# Altium project Zybo_Z7.PrjPcb (part 3 of 3)

## Sheet Power_Regulation.SchDoc
size A4; SheetNumber: 13; SheetTotal: 13
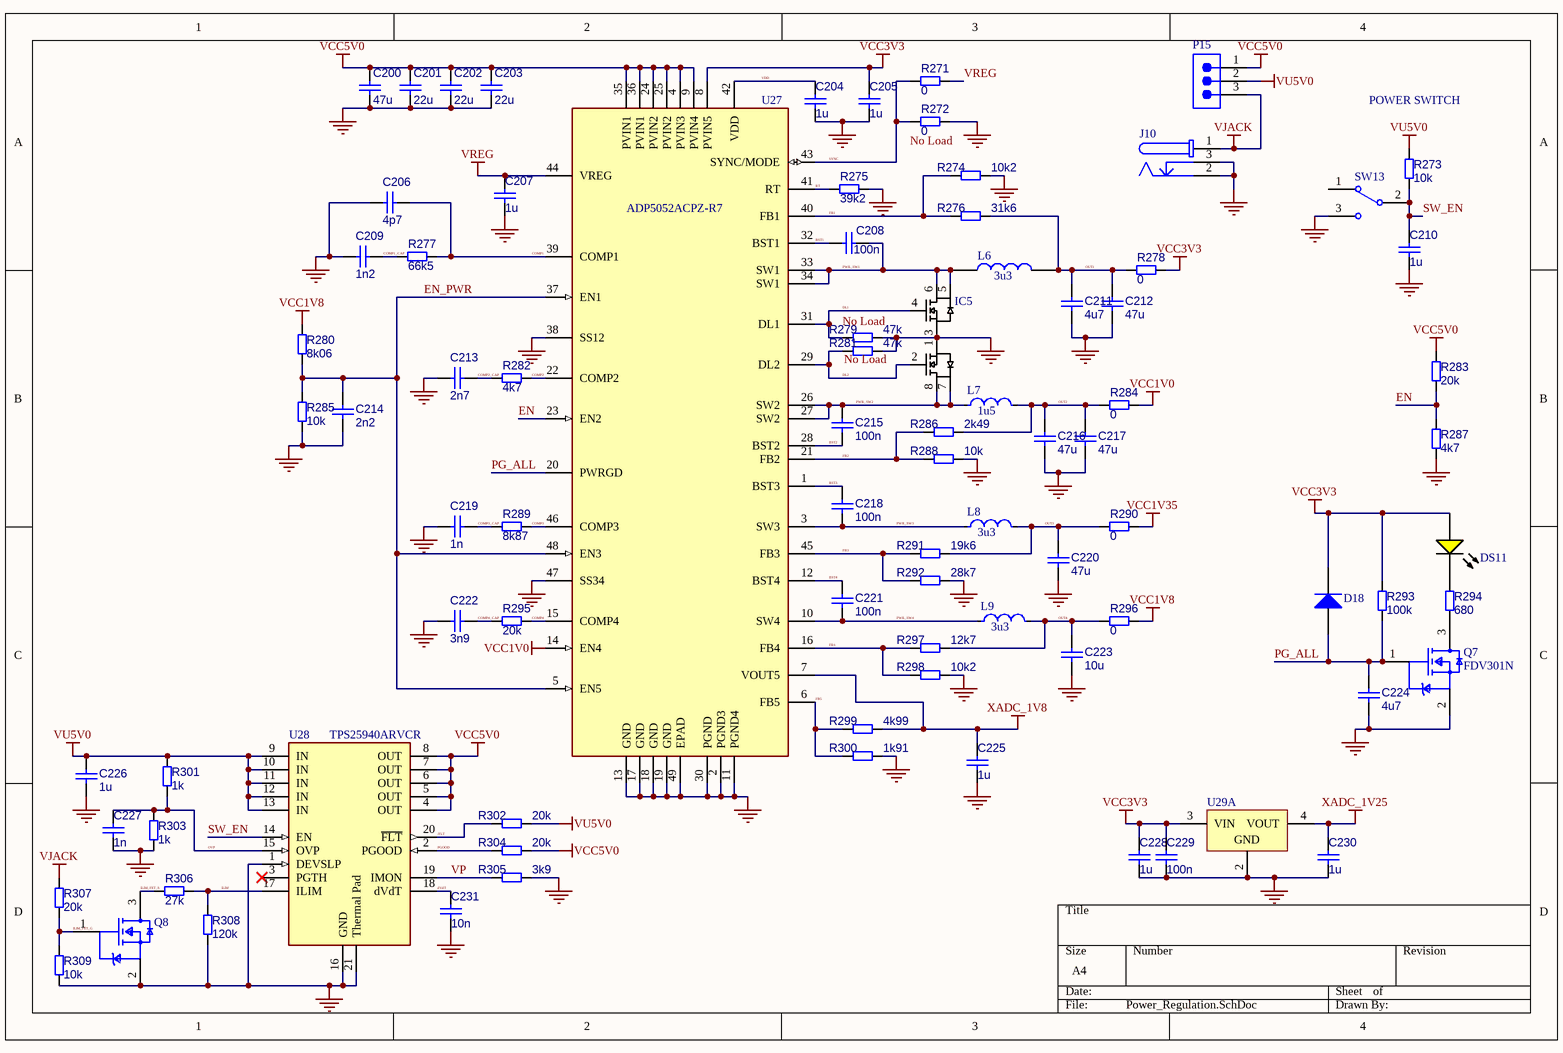
[diagram p12: Power_Regulation.SchDoc]

### Parts
C200  47u  [C_1210]
C201  22u  [C_1210]
C202  22u  [C_1210]
C203  22u  [C_1210]
C204  1u  [C_0402]
C205  1u  [C_0402]
C206  4p7  [CAPC1005X50N_0402]
C207  1u  [C_0402]
C208  100n  [CAPC1005X50N_0402]
C209  1n2  [CAPC1005X50N_0402]
C210  1u  [C_0402]
C211  4u7  [C_0805]
C212  47u  [C_1210]
C213  2n7  [CAPC1005X50N_0402]
C214  2n2  [CAPC1005X50N_0402]
C215  100n  [CAPC1005X50N_0402]
C216  47u  [C_1210]
C217  47u  [C_1210]
C218  100n  [CAPC1005X50N_0402]
C219  1n  [CAPC1005X50N_0402]
C220  47u  [C_1210]
C221  100n  [CAPC1005X50N_0402]
C222  3n9  [CAPC1005X50N_0402]
C223  10u  [C_0805]
C224  4u7  [C_0805]
C225  1u  [C_0402]
C226  1u  [C_0805]
C227  1n  [CAPC1005X50N_0402]
C228  1u  [C_0402]
C229  100n  [CAPC1005X50N_0402]
C230  1u  [C_0402]
C231  10n  [CAPC1005X50N_0402]
D18  BAS16XV2T1G  [ONSC-SOD-523-2-502-01_V]  (value not drawn)
DS11  19-217/Y5C-AM1N1VY/3T  [EVRL-0603-2_V]  (value not drawn)
IC5  FDS9926A  [SOIC127P600X175-8N]  (value not drawn)
J10  694108301002  [694108301002]  (value not drawn)
L6  3u3  [ETQP3M_4M_YFP]
L7  1u5  [FP-IHLP-2020CZ-FP_1_905x2-MFG]
L8  3u3  [FP-IHLP-2020CZ-FP_1_905x2-MFG]
L9  3u3  [FP-IHLP-2020CZ-FP_1_905x2-MFG]
P15  Male Pin Header 1x3 2.54mm  [Copy of Copy of Copy of Copy of Copy of 3M-2340-6111TG_V]  (value not drawn)
Q7  FDV301N  [FP-318-08-MFG]
Q8  FDV301N  [FP-318-08-MFG]  (value not drawn)
R271  0  [R_0402]
R272  0  [R_0402]
R273  10k  [R_0402]
R274  10k2  [R_0402]
R275  39k2  [R_0402]
R276  31k6  [R_0402]
R277  66k5  [R_0402]
R278  0  [R_0402]
R279  47k  [R_0402]
R280  8k06  [R_0402]
R281  47k  [R_0402]
R282  4k7  [R_0402]
R283  20k  [R_0402]
R284  0  [R_0402]
R285  10k  [R_0402]
R286  2k49  [R_0402]
R287  4k7  [R_0402]
R288  10k  [R_0402]
R289  8k87  [R_0402]
R290  0  [R_0402]
R291  19k6  [R_0402]
R292  28k7  [R_0402]
R293  100k  [R_0402]
R294  680  [R_0402]
R295  20k  [R_0402]
R296  0  [R_0402]
R297  12k7  [R_0402]
R298  10k2  [R_0402]
R299  4k99  [R_0402]
R300  1k91  [R_0402]
R301  1k  [R_0402]
R302  20k  [R_0402]
R303  1k  [R_0402]
R304  20k  [R_0402]
R305  3k9  [R_0402]
R306  27k  [R_0402]
R307  20k  [R_0402]
R308  120k  [R_0402]
R309  10k  [R_0402]
SW13  EG1218  [ESWI-EG1218_V]  (value not drawn)
U27  ADP5052ACPZ-R7  [FP-CP-48-13-IPC_B]
U28  TPS25940ARVCR  [FP-RVC0020A-IPC_A]
U29  ADR127BUJZ-REEL7  [ADI-UJ-6_M]  (value not drawn)  (part A of 2)

### Nets
GND: C200.2 C201.2 C202.2 C203.2 C204.1 C205.1 C206.2 C207.1 C209.2 C210.1 C211.1 C212.2 C213.1 C214.2 C216.2 C217.2 C219.1 C220.2 C222.1 C223.1 C224.1 C225.1 C226.1 C227.1 C228.1 C229.1 C230.1 C231.1 IC5.1(S2) IC5.3(S1) J10.2 J10.3 Q7.2(S) Q8.2(S) R272.2 R274.2 R275.2 R279.2 R281.2 R285.2 R287.2 R288.2 R292.2 R298.2 R300.2 R303.1 R305.2 R308.1 R309.1 SW13.3 U27.2(PGND3) U27.11(PGND4) U27.13(GND) U27.17(GND) U27.18(GND) U27.19(GND) U27.30(PGND) U27.38(SS12) U27.47(SS34) U27.49(EPAD) U28.1(DEVSLP) U28.16(GND) U28.21(Thermal_Pad) U29.2(GND)
VCC1V0: R284.1 U27.14(EN4)
VCC1V8: R280.1 R296.1
VCC1V35: R290.1
VCC3V3: C205.2 C228.2 C229.2 D18.1(K) DS11.1(A) R278.1 R293.1 U27.8(PVIN5) U29.3(VIN)
VCC5V0: C200.1 C201.1 C202.1 C203.1 P15.1 R283.1 R304.2 U27.4(PVIN3) U27.9(PVIN4) U27.24(PVIN2) U27.25(PVIN2) U27.35(PVIN1) U27.36(PVIN1) U28.4(OUT) U28.5(OUT) U28.6(OUT) U28.7(OUT) U28.8(OUT)
VJACK: J10.1 P15.3 R307.2
VREG: C207.2 R271.2 U27.44(VREG)
VU5V0: C226.2 P15.2 R273.1 R301.2 R302.2 U28.9(IN) U28.10(IN) U28.11(IN) U28.12(IN) U28.13(IN)
XADC_1V8: C225.2 R299.2 U27.7(VOUT5)
XADC_1V25: C230.2 U29.4(VOUT)
/FLT: R302.1 U28.20(~{FLT})
BST1: C208.1 U27.32(BST1)
BST2: C215.2 U27.28(BST2)
BST3: C218.1 U27.1(BST3)
BST4: C221.1 U27.12(BST4)
COMP1: C206.1 R277.1 U27.39(COMP1)
COMP1_CAP: C209.1 R277.2
COMP2: R282.2 U27.22(COMP2)
COMP2_CAP: C213.2 R282.1
COMP3: R289.2 U27.46(COMP3)
COMP3_CAP: C219.2 R289.1
COMP4: R295.2 U27.15(COMP4)
COMP4_CAP: C222.2 R295.1
DL1: IC5.4(G1) R279.1 U27.31(DL1)
DL2: IC5.2(G2) R281.1 U27.29(DL2)
dVdT: C231.2 U28.18(dVdT)
EN: R283.2 R287.1 U27.23(EN2)
EN_PWR: C214.1 R280.2 R285.1 U27.5(EN5) U27.37(EN1) U27.48(EN3)
FB1: R274.1 R276.1 U27.40(FB1)
FB2: R286.1 R288.1 U27.21(FB2)
FB3: R291.1 R292.1 U27.45(FB3)
FB4: R297.1 R298.1 U27.16(FB4)
FB5: R299.1 R300.1 U27.6(FB5)
ILIM: R306.1 R308.2 U28.17(ILIM)
ILIM_FET_G: Q8.1(G) R307.1 R309.2
ILIM_FET_S: Q8.3(D) R306.2
OUT1: C211.2 C212.1 L6.2 R276.2 R278.2
OUT2: C216.1 C217.1 L7.2 R284.2 R286.2
OUT3: C220.1 L8.2 R290.2 R291.2
OUT4: C223.2 L9.2 R296.2 R297.2
OVP: C227.2 R301.1 R303.2 U28.15(OVP)
PG_ALL: C224.2 D18.2(A) Q7.1(G) R293.2 U27.20(PWRGD)
PGOOD: R304.1 U28.2(PGOOD)
PWR_SW1: C208.2 IC5.5(D1_1) IC5.6(D1_2) L6.1 U27.33(SW1) U27.34(SW1)
PWR_SW2: C215.1 IC5.7(D2_1) IC5.8(D2_2) L7.1 U27.26(SW2) U27.27(SW2)
PWR_SW3: C218.2 L8.1 U27.3(SW3)
PWR_SW4: C221.2 L9.1 U27.10(SW4)
RT: R275.1 U27.41(RT)
SW_EN: C210.2 R273.2 SW13.2(COM) U28.14(EN)
SYNC: R271.1 R272.1 U27.43(SYNC/MODE)
VDD: C204.2 U27.42(VDD)
VP: R305.1 U28.19(IMON)
NetDS11_2: DS11.2(K) R294.1
NetQ7_3: Q7.3(D) R294.2

Not connected (* = marked no-connect by the designer): SW13 1; U28 3(PGTH)*

### Notes on the sheet
- (near R273) POWER SWITCH
- (near R272) No Load
- (near R279) No Load
- (near R281) No Load

### Library data of the parts
C200-C203 C212 C216 C217 C220 = CMP-001-00088-1: as C93-C95 on sheet FPGA_Power
C204 C205 C207 C210 C225 C228 C230 = CMP-001-00085-2: MLCC 0603
C206 C208 C209 C213-C215 C218 C219 C221 C222 C227 C229 C231 = CMP-001-00084-2: MLCC 0402
C211 C223 C224 C226 = CMP-001-00086-2: MLCC 0805
D18 = CMP-1054-00076-1: Switching Diode, 2-Pin SOD-523, Pb-Free, Tape and Reel; Manufacturer: On Semiconductor; trr Max (ns): 6; Configuration: Single; IF Max (A): 0.2; ComponentLink1URL: http://www.onsemi.com/; DatasheetVersion: Rev. 7; RoHS: TRUE; PackageVersion: Rev. E, 09/2010; Packing: Tape and Reel; ComponentLink2Description: Datasheet; ComponentLink2URL: http://www.onsemi.com/pub_link/Collateral/BAS16XV2T1-D.PDF; ComponentLink3Description: Package Specification; PackageReference: SOD-523-2-502-01; ComponentLink1Description: Manufacturer URL; PartNumber: BAS16XV2T1G; Mounting Technology: Surface Mount; PackageDescription: 2-Pin SOD, Body 1.2 x 0.8 mm; ComponentLink3URL: http://www.onsemi.com/pub_link/Collateral/502-01.PDF
DS11 = CMP-007-00005-2: Chip LED, Yellow, 5 V, 25mA, -40 to 85 degC, 2-Pin SMD (0603), RoHS, Tape and Reel; Manufacturer: Everlight Electronics; Datasheet Version: Rev. 1.0, 12/2005; Package Reference: 0603; Mounting Technology: SM; Package Description: 2-Pin Surface Mount Device, Body 1.6 x 0.8 mm; Case/Package: 0603; Datasheet URL: http://www.fairchip.com/pdf/Everlight/19-217-Y5C-AM1N1VY-3T.pdf; Manufacturer URL: http://www.everlight.com/; RoHS Compliant: False
IC5 = FDS9926A: Integrated Circuit; Manufacturer_Name: onsemi; Datasheet Link: https://www.onsemi.com/pub/Collateral/FDS9926A-D.PDF; Height: 1.75mm; Manufacturer_Part_Number: FDS9926A; Mouser Part Number: 512-FDS9926A; Mouser Price/Stock: https://www.mouser.co.uk/ProductDetail/onsemi-Fairchild/FDS9926A?qs=HK%252BeIG1iaagpgrEVRWCDdA%3D%3D; Arrow Part Number: FDS9926A; Arrow Price/Stock: https://www.arrow.com/en/products/fds9926a/on-semiconductor?utm_currency=USD&region=nac
J10 = CMP-1502-00190-4: DC Power Jack Connector WR-DC, Male, Right Angled, THT, 5 A, 24 V; Operating Supply Voltage: 24V; Shielding: Unshielded; Voltage Rating: 30V; Number of Contacts: 3; Insulation Resistance: 100MΩ; Current Rating: 5A; Min Operating Temperature: -40°C; Packaging: Bulk; Connector Type: Power; Housing Material: Polyamide; REACH SVHC: Unknown; Termination: Through Hole; Contact Gender: Female; Mount: Through Hole; RoHS: Compliant; Flammability Rating: UL94 V-0; Height: 11mm; Max Operating Temperature: 85°C; Contact Plating: Tin; Color: Black; Gender: Male; Contact Material: Gold, Tin
L6 = ETQ-P3M3R3YFP: Inductor; Manufacturer_Name: Panasonic; Datasheet Link: https://industrial.panasonic.com/cdbs/www-data/pdf/AGL0000/AGL0000C59.pdf; Height: 4mm; Manufacturer_Part_Number: ETQ-P3M3R3YFP; Mouser Part Number: 667-ETQ-P3M3R3YFP; Mouser Price/Stock: https://www.mouser.co.uk/ProductDetail/Panasonic/ETQ-P3M3R3YFP?qs=sL7MMaRBAPWa%252BM34GljCkQ%3D%3D; Arrow Part Number: ETQ-P3M3R3YFP; Arrow Price/Stock: https://www.arrow.com/en/products/etq-p3m3r3yfp/panasonic.html?utm_currency=USD&region=nac
L7-L9 = CMP-02424-000709-1: Fixed Inductors Commercial High Saturation Series 1.5uH 7.2A 20.7mΩ 20%; Max DC Current: 11A; DC Resistance (DCR): 20.7mR; Core Material: Metal; Shielding: Shielded; Test Frequency: 100kHz; Self Resonant Frequency: 5MHz; Length: 5.49mm; Package Quantity: 2000; Height - Seated (Max): 0.118inch; Inductance Tolerance: 20%; Lead Free: Lead Free; Current Rating: 7.2A; Max Operating Temperature: 125°C; Series: IHLP-2020CZ-01; Termination: SMD/SMT; RoHS Compliant: Yes; Width: 5.18mm; Military Standard: Not; Inductance: 1.5uH; Radiation Hardening: No; Case/Package: 2020; Saturation Current: 11A; Packaging: Tape and Reel; RMS Current (Irms): 7.2A; Tolerance: 20%; Depth: 5.43mm; Min Operating Temperature: -55°C; Mount: Surface Mount; Height: 3mm
P15 = CMP-002-00080-1: Male Header, Pitch 2.54 mm, 1x3 Position, Height 8.636 mm, Tail Length 3.05 mm, -55 to 105 degC, RoHS, Bulk; Manufacturer: 3M; Rows: 1; Current Rating: 3A; Mounting Technology: TH; Contact Plating: Gold; Packaging: Bulk; Lead Pitch: 0.1inch; Case/Package: 2340-6111TG; Contact Material: Copper; Pins: 40; Package Description: Male Header, Pitch 2.54 mm, 1 x 40 Position, Height 8.636 mm, Tail Length 3.05 mm; RoHS Compliant: True; Connector Type: Header; Manufacturer URL: http://www.3m.com/; Contact Finish: Gold; Max Operating Temperature: 105°C; Min Operating Temperature: -55°C; Max Current Rating: 3A; Gender: Male; Package Quantity: 200; Colour: Black; Package Reference: 2340-6111TG; Datasheet URL: https://datasheet.ciiva.com/5161/ts0766-242217-5161112.pdf; Datasheet Version: Aug-08
Q7 Q8 = CMP-2000-04935-2: MOSFET N-CH 25V 220MA SOT-23; Manufacturer: ON Semiconductor; Turn Off Delay Time: 3.5ns; Typ Forward Diode Voltage: 0.8V; Max Junction Temp: +150°C; Threshold Vgs Max: 1.06V; Threshold Vgs Min: 0.7V; Standoff Height: 0.01mm; Max Forward Diode Voltage: 1.2V; Number Of Channels: 1; Rthja Max: 357°C/W; Drain To Source Resistance: 3.1Ω; Input Capacitace At Vds: 9.5pF @ 10V; Gate Charge At Vgs: 0.49nC @ 4.5V; Transconductance: 0.2S; Turn On Delay Time: 3.2ns; Depletion Mode: False; Power Dissipation: 0.35W; Continuous Drain Current: 0.22A; Gate To Source Voltage: 8V; RoHS: TRUE; Lead Free: Yes; Temperature Range High: +150°C; Automotive: No; Height: 1.11mm; Category: Trans; Mouser Description: MOSFET N-Ch Digital; Drain To Source Voltage: 25V; Temperature: -55°C to +150°C; Ipc Land Pattern Name: SOT95P240X100-3; Device Class L1: Discrete Semiconductors; Octopart: https://octopart.com/fdv301n-on+semiconductor-84326713; Footprint Url: https://www.onsemi.com/pub/Collateral/318-08.PDF; Digikey Description: MOSFET N-CH 25V 220MA SOT-23; Drain To Source Breakdown Voltage: 25V; Temperature Range Low: -55°C; Number Of N Channels: 1; Device Class L3: MOSFETs; Package: 318-08; ComponentLink2URL: https://www.onsemi.com/pub/Collateral/FDV301N-D.PDF; Manufacturer Part Number: FDV301N; Device Class L2: Transistors; ComponentLink2Description: Datasheet
R271-R309 = CMP-009-00178-3: Chip 0402 resistor
SW13 = CMP-011-00006-2: Slide Switch, SPDT, 500 V, -20 to 70 degC, 3-Pin THD, RoHS, Bulk; Manufacturer: E-Switch; Voltage Rating (DC): 30V; Current Rating: 200mA; Operating Force: 250gf; Package Quantity: 1000; Contact Plating: Silver; Max Operating Temperature: 70°C; Min Operating Temperature: -20°C; Contact Material: Copper; Datasheet URL: https://www.e-switch.com/system/asset/product_line/data_sheet/119/EG.pdf; Contact Finish: Silver; Case/Package: EG1218; Voltage Rating (AC): 30V; Datasheet Version: Oct-15; Package Description: 3-Pin Through Hole Device, Body 11.6 x 4 mm, Pitch 2.5 mm; RoHS Compliant: True; Package Reference: EG1218; Manufacturer URL: http://www.e-switch.ch/en/; Throw Configuration: SPDT; Contact Current Rating: 200mA; Mounting Technology: TH; Packaging: Bulk; Pins: 3
U27 = CMP-019-00062-1: 5-Channel Integrated Power Solution with Quad Buck Regulators and 200 mA LDO Regulator; Nominal Supply Current: 4.8mA; Output Voltage: 3.305V; Min Supply Voltage: 4.5V; Output Current: 200mA; Max Supply Voltage: 15V; Pins: 48; Max Operating Temperature: 125°C; Mounting Technology: Surface Mount; Min Operating Temperature: -40°C; Case/Package: LFCSP EP
U28 = CMP-019-00063-1: 2.7-V to 18-V, 42mΩ, 0.6-5.2A eFuse with reverse current blocking and DevSleep support 20-WQFN -40 to 85; Output Current: 5.3A; Max Supply Voltage: 18V; Nominal Supply Current: 2.02mA; Min Supply Voltage: 2.7V; Mounting Technology: Surface Mount; Pins: 20; Max Operating Temperature: 85°C; Min Operating Temperature: -40°C
U29 = CMP-0784-00537-1: Precision, Micropower LDO Voltage Reference in TSOT, 1.25 V Output, 2.7 to 18 V Supply, Industrial, 6-pin SOT23 (UJ-6), Reel; Manufacturer: Analog Devices; Max V Supply (V): 18; Vout: 1.25V; Ref Out TC (ppm/C): 3; Min V Supply (V): 2.7; ComponentLink1URL: http://www.analog.com/en/index.html; PartNumber: ADR127BUJZ-REEL7; Operating Temp Range: -40 to 125 degC; ComponentLink4URL: Product URL:http://www.analog.com/en/special-linear-functions/voltage-references/adr127/products/product.html; ComponentLink1Description: Manufacturer URL; Code_JEDEC: MO-193-AA; Packing: Reel; ComponentLink3Description: Package Specification; ComponentLink2URL: http://www.analog.com/static/imported-files/data_sheets/ADR121_125_127.pdf; ComponentLink2Description: Datasheet; DatasheetVersion: Rev. B; Mounting Technology: Surface Mount; PackageReference: UJ-6; PackageDescription: 6-Pin Thin Small Outline Transistor Package, Body 2.9 x 1.6 mm, Pitch 0.95 mm; ComponentLink3URL: http://www.analog.com/static/imported-files/packages/PKG_PDF/TSOT(UJ)/UJ_6.pdf; ComponentLink4Description: URL Link1; PackageVersion: Dec-04

## Nets that join several sheets
DDR3_VREF: DDR_and_MIO_Banks (6 pins), DDR3_Memory (8 pins)
GND: PMODs_MIO (75 pins), MIPI_General_IO (28 pins), Ethernet_and_SD_Card (43 pins), Audio_Codec (41 pins), HDMI_Source (16 pins), HDMI_Sink (30 pins), USB_OTG (18 pins), FPGA_Config_Flash (26 pins), DDR_and_MIO_Banks (16 pins), FPGA_Power (132 pins), DDR3_Memory (85 pins), Power_Regulation (64 pins)
VCC1V0: Ethernet_and_SD_Card (C8.2 FB8.1), FPGA_Power (36 pins), Power_Regulation (R284.1 U27.14)
VCC1V8: USB_OTG (R188.2), FPGA_Power (23 pins), Power_Regulation (R280.1 R296.1)
VCC1V8_IO: PMODs_MIO (SW1.3 SW1.4 SW2.3 SW2.4), Ethernet_and_SD_Card (6 pins), USB_OTG (C68.2 R187.2 U20.11 U20.32), DDR_and_MIO_Banks (R233.1 R249.2), FPGA_Power (10 pins)
VCC1V35: DDR_and_MIO_Banks (R232.1 R248.2), FPGA_Power (22 pins), DDR3_Memory (76 pins), Power_Regulation (R290.1)
VCC3V3: PMODs_MIO (12 pins), MIPI_General_IO (13 pins), Ethernet_and_SD_Card (16 pins), Audio_Codec (FB5.1 R120.2 R132.1 R133.1), HDMI_Source (19 pins), HDMI_Sink (36 pins), USB_OTG (C71.2 R190.1 U20.20 U20.21), FPGA_Config_Flash (14 pins), DDR_and_MIO_Banks (8 pins), FPGA_Power (42 pins), Power_Regulation (9 pins)
VCC5V0: MIPI_General_IO (6 pins), Audio_Codec (FB6.1), HDMI_Source (F1.1), USB_OTG (C69.2 U21.5), FPGA_Config_Flash (C77.2 D16.2), Power_Regulation (18 pins)
XADC_1V8: FPGA_Config_Flash (1.J9 C75.2), Power_Regulation (C225.2 R299.2 U27.7)
XADC_1V25: FPGA_Config_Flash (1.L9 C74.2), Power_Regulation (C230.2 U29.4)
AC_BCLK: Audio_Codec (R123.1), FPGA_Banks_and_Filters (1.H16)
AC_MCLK: Audio_Codec (R128.1), FPGA_Banks_and_Filters (1.J14)
AC_MUTEN: Audio_Codec (R130.1 U15.25), FPGA_Banks_and_Filters (1.G14)
AC_PBDAT: Audio_Codec (U15.8), FPGA_Banks_and_Filters (1.J20)
AC_PBLRC: Audio_Codec (U15.9), FPGA_Banks_and_Filters (1.J15)
AC_RECDAT: Audio_Codec (U15.10), FPGA_Banks_and_Filters (1.M14)
AC_RECLRC: Audio_Codec (U15.11), FPGA_Banks_and_Filters (1.M15)
AC_SCL: Audio_Codec (R132.2 U15.28), FPGA_Banks_and_Filters (1.G15)
AC_SDA: Audio_Codec (R133.2 U15.27), FPGA_Banks_and_Filters (1.H15)
BTN0: MIPI_General_IO (R63.1), FPGA_Banks_and_Filters (1.R19)
BTN1: MIPI_General_IO (R59.1), FPGA_Banks_and_Filters (1.J16)
BTN2: MIPI_General_IO (R57.1), FPGA_Banks_and_Filters (1.G19)
BTN3: MIPI_General_IO (R55.1), FPGA_Banks_and_Filters (1.N17)
CAM_CLK: MIPI_General_IO (J1.12), FPGA_Banks_and_Filters (1.V16)
CAM_GPIO: MIPI_General_IO (J1.11), FPGA_Banks_and_Filters (1.W16)
CAM_SCL: MIPI_General_IO (J1.13), FPGA_Banks_and_Filters (1.T20)
CAM_SDA: MIPI_General_IO (J1.14), FPGA_Banks_and_Filters (1.U20)
CRYPTO_SDA: FPGA_Config_Flash (R198.1 U22.5), FPGA_Banks_and_Filters (1.H17)
DDR3_A0: DDR_and_MIO_Banks (R228.2), DDR3_Memory (U25.N3 U26.N3)
DDR3_A1: DDR_and_MIO_Banks (R227.2), DDR3_Memory (U25.P7 U26.P7)
DDR3_A2: DDR_and_MIO_Banks (R226.2), DDR3_Memory (U25.P3 U26.P3)
DDR3_A3: DDR_and_MIO_Banks (R225.2), DDR3_Memory (U25.N2 U26.N2)
DDR3_A4: DDR_and_MIO_Banks (R224.2), DDR3_Memory (U25.P8 U26.P8)
DDR3_A5: DDR_and_MIO_Banks (R223.2), DDR3_Memory (U25.P2 U26.P2)
DDR3_A6: DDR_and_MIO_Banks (R222.2), DDR3_Memory (U25.R8 U26.R8)
DDR3_A7: DDR_and_MIO_Banks (R221.2), DDR3_Memory (U25.R2 U26.R2)
DDR3_A8: DDR_and_MIO_Banks (R220.2), DDR3_Memory (U25.T8 U26.T8)
DDR3_A9: DDR_and_MIO_Banks (R219.2), DDR3_Memory (U25.R3 U26.R3)
DDR3_A10: DDR_and_MIO_Banks (R217.2), DDR3_Memory (U25.L7 U26.L7)
DDR3_A11: DDR_and_MIO_Banks (R215.2), DDR3_Memory (U25.R7 U26.R7)
DDR3_A12: DDR_and_MIO_Banks (R213.2), DDR3_Memory (U25.N7 U26.N7)
DDR3_A13: DDR_and_MIO_Banks (R211.2), DDR3_Memory (U25.T3 U26.T3)
DDR3_A14: DDR_and_MIO_Banks (R209.2), DDR3_Memory (U25.T7 U26.T7)
DDR3_BA0: DDR_and_MIO_Banks (R231.2), DDR3_Memory (U25.M2 U26.M2)
DDR3_BA1: DDR_and_MIO_Banks (R230.2), DDR3_Memory (U25.N8 U26.N8)
DDR3_BA2: DDR_and_MIO_Banks (R229.2), DDR3_Memory (U25.M3 U26.M3)
DDR3_CAS: DDR_and_MIO_Banks (R236.2), DDR3_Memory (U25.K3 U26.K3)
DDR3_CK_N: DDR_and_MIO_Banks (1.M2 R242.1), DDR3_Memory (U25.K7 U26.K7)
DDR3_CK_P: DDR_and_MIO_Banks (1.L2 R242.2), DDR3_Memory (U25.J7 U26.J7)
DDR3_CKE0: DDR_and_MIO_Banks (R241.2), DDR3_Memory (U25.K9 U26.K9)
DDR3_CS: DDR_and_MIO_Banks (R237.2), DDR3_Memory (U25.L2 U26.L2)
DDR3_D0: DDR_and_MIO_Banks (1.E3), DDR3_Memory (U25.E3)
DDR3_D1: DDR_and_MIO_Banks (1.H1), DDR3_Memory (U25.F7)
DDR3_D2: DDR_and_MIO_Banks (1.E2), DDR3_Memory (U25.F2)
DDR3_D3: DDR_and_MIO_Banks (1.G3), DDR3_Memory (U25.F8)
DDR3_D4: DDR_and_MIO_Banks (1.J3), DDR3_Memory (U25.H3)
DDR3_D5: DDR_and_MIO_Banks (1.H2), DDR3_Memory (U25.H8)
DDR3_D6: DDR_and_MIO_Banks (1.H3), DDR3_Memory (U25.G2)
DDR3_D7: DDR_and_MIO_Banks (1.J1), DDR3_Memory (U25.H7)
DDR3_D8: DDR_and_MIO_Banks (1.D3), DDR3_Memory (U25.D7)
DDR3_D9: DDR_and_MIO_Banks (1.B3), DDR3_Memory (U25.C3)
DDR3_D10: DDR_and_MIO_Banks (1.E1), DDR3_Memory (U25.C8)
DDR3_D11: DDR_and_MIO_Banks (1.C3), DDR3_Memory (U25.C2)
DDR3_D12: DDR_and_MIO_Banks (1.C1), DDR3_Memory (U25.A7)
DDR3_D13: DDR_and_MIO_Banks (1.A4), DDR3_Memory (U25.A2)
DDR3_D14: DDR_and_MIO_Banks (1.D1), DDR3_Memory (U25.B8)
DDR3_D15: DDR_and_MIO_Banks (1.A2), DDR3_Memory (U25.A3)
DDR3_D16: DDR_and_MIO_Banks (1.U4), DDR3_Memory (U26.E3)
DDR3_D17: DDR_and_MIO_Banks (1.R3), DDR3_Memory (U26.F7)
DDR3_D18: DDR_and_MIO_Banks (1.U2), DDR3_Memory (U26.F2)
DDR3_D19: DDR_and_MIO_Banks (1.U3), DDR3_Memory (U26.F8)
DDR3_D20: DDR_and_MIO_Banks (1.R1), DDR3_Memory (U26.H3)
DDR3_D21: DDR_and_MIO_Banks (1.P3), DDR3_Memory (U26.H8)
DDR3_D22: DDR_and_MIO_Banks (1.T4), DDR3_Memory (U26.G2)
DDR3_D23: DDR_and_MIO_Banks (1.P1), DDR3_Memory (U26.H7)
DDR3_D24: DDR_and_MIO_Banks (1.W3), DDR3_Memory (U26.D7)
DDR3_D25: DDR_and_MIO_Banks (1.W1), DDR3_Memory (U26.C3)
DDR3_D26: DDR_and_MIO_Banks (1.Y4), DDR3_Memory (U26.C8)
DDR3_D27: DDR_and_MIO_Banks (1.V1), DDR3_Memory (U26.C2)
DDR3_D28: DDR_and_MIO_Banks (1.Y2), DDR3_Memory (U26.A7)
DDR3_D29: DDR_and_MIO_Banks (1.V2), DDR3_Memory (U26.A2)
DDR3_D30: DDR_and_MIO_Banks (1.Y3), DDR3_Memory (U26.B8)
DDR3_D31: DDR_and_MIO_Banks (1.V3), DDR3_Memory (U26.A3)
DDR3_DM0: DDR_and_MIO_Banks (1.F1), DDR3_Memory (U25.E7)
DDR3_DM1: DDR_and_MIO_Banks (1.A1), DDR3_Memory (U25.D3)
DDR3_DM2: DDR_and_MIO_Banks (1.T1), DDR3_Memory (U26.E7)
DDR3_DM3: DDR_and_MIO_Banks (1.Y1), DDR3_Memory (U26.D3)
DDR3_DQS0_N: DDR_and_MIO_Banks (1.F2), DDR3_Memory (U25.G3)
DDR3_DQS0_P: DDR_and_MIO_Banks (1.G2), DDR3_Memory (U25.F3)
DDR3_DQS1_N: DDR_and_MIO_Banks (1.B2), DDR3_Memory (U25.B7)
DDR3_DQS1_P: DDR_and_MIO_Banks (1.C2), DDR3_Memory (U25.C7)
DDR3_DQS2_N: DDR_and_MIO_Banks (1.T2), DDR3_Memory (U26.G3)
DDR3_DQS2_P: DDR_and_MIO_Banks (1.R2), DDR3_Memory (U26.F3)
DDR3_DQS3_N: DDR_and_MIO_Banks (1.W4), DDR3_Memory (U26.B7)
DDR3_DQS3_P: DDR_and_MIO_Banks (1.W5), DDR3_Memory (U26.C7)
DDR3_ODT0: DDR_and_MIO_Banks (R244.2), DDR3_Memory (U25.K1 U26.K1)
DDR3_RAS: DDR_and_MIO_Banks (R235.2), DDR3_Memory (U25.J3 U26.J3)
DDR3_RESET: DDR_and_MIO_Banks (1.B4), DDR3_Memory (R270.2 U25.T2 U26.T2)
DDR3_WE: DDR_and_MIO_Banks (R238.2), DDR3_Memory (U25.L3 U26.L3)
ETH_INT_PU_B: Ethernet_and_SD_Card (IC1.31), FPGA_Banks_and_Filters (1.P14)
ETH_MDC: Ethernet_and_SD_Card (IC1.13), DDR_and_MIO_Banks (1.C10)
ETH_MDIO: Ethernet_and_SD_Card (IC1.14 R108.1), DDR_and_MIO_Banks (1.C11)
ETH_RST_B: Ethernet_and_SD_Card (C1.2 D1.2 IC1.12 R90.1), FPGA_Banks_and_Filters (1.U13)
ETH_RXCK: Ethernet_and_SD_Card (R102.1), DDR_and_MIO_Banks (1.B17)
ETH_RXCTL: Ethernet_and_SD_Card (R101.1), DDR_and_MIO_Banks (1.D13)
ETH_RXD0: Ethernet_and_SD_Card (R93.1), DDR_and_MIO_Banks (1.D11)
ETH_RXD1: Ethernet_and_SD_Card (R98.1), DDR_and_MIO_Banks (1.A16)
ETH_RXD2: Ethernet_and_SD_Card (R99.1), DDR_and_MIO_Banks (1.F15)
ETH_RXD3: Ethernet_and_SD_Card (R100.1), DDR_and_MIO_Banks (1.A15)
ETH_TXCK: Ethernet_and_SD_Card (IC1.20), DDR_and_MIO_Banks (R207.1)
ETH_TXCTL: Ethernet_and_SD_Card (IC1.19), DDR_and_MIO_Banks (R216.1)
ETH_TXD0: Ethernet_and_SD_Card (IC1.18), DDR_and_MIO_Banks (R208.1)
ETH_TXD1: Ethernet_and_SD_Card (IC1.17), DDR_and_MIO_Banks (R210.1)
ETH_TXD2: Ethernet_and_SD_Card (IC1.16), DDR_and_MIO_Banks (R212.1)
ETH_TXD3: Ethernet_and_SD_Card (IC1.15), DDR_and_MIO_Banks (R214.1)
FAN_FB_PU: FPGA_Config_Flash (R206.1), FPGA_Banks_and_Filters (1.Y12)
HDMI_RX0_N: HDMI_Sink (R161.1 U19.16), FPGA_Banks_and_Filters (1.G18)
HDMI_RX0_P: HDMI_Sink (R160.1 U19.15), FPGA_Banks_and_Filters (1.G17)
HDMI_RX1_N: HDMI_Sink (R163.1 U19.13), FPGA_Banks_and_Filters (1.F20)
HDMI_RX1_P: HDMI_Sink (R162.1 U19.12), FPGA_Banks_and_Filters (1.F19)
HDMI_RX2_N: HDMI_Sink (R165.1 U19.10), FPGA_Banks_and_Filters (1.H18)
HDMI_RX2_P: HDMI_Sink (R164.1 U19.9), FPGA_Banks_and_Filters (1.J18)
HDMI_RX_CEC: HDMI_Sink (D12.1 J7.13), FPGA_Banks_and_Filters (1.Y9)
HDMI_RX_CLK_N: HDMI_Sink (R159.1 U19.19), FPGA_Banks_and_Filters (1.K18)
HDMI_RX_CLK_P: HDMI_Sink (R158.1 U19.18), FPGA_Banks_and_Filters (1.K17)
HDMI_RX_HPD: HDMI_Sink (R157.2 U18.2), FPGA_Banks_and_Filters (1.L15)
HDMI_RX_SCL: HDMI_Sink (R183.1 U19.22), FPGA_Banks_and_Filters (1.L14)
HDMI_RX_SDA: HDMI_Sink (R184.1 U19.23), FPGA_Banks_and_Filters (1.H20)
HDMI_TX0_N: HDMI_Source (IC3.11 R143.2), FPGA_Banks_and_Filters (1.W13)
HDMI_TX0_P: HDMI_Source (IC3.10 R144.2), FPGA_Banks_and_Filters (1.V12)
HDMI_TX1_N: HDMI_Source (IC3.8 R145.2), FPGA_Banks_and_Filters (1.T10)
HDMI_TX1_P: HDMI_Source (IC3.7 R146.2), FPGA_Banks_and_Filters (1.T11)
HDMI_TX2_N: HDMI_Source (IC3.6 R147.2), FPGA_Banks_and_Filters (1.U12)
HDMI_TX2_P: HDMI_Source (IC3.5 R148.2), FPGA_Banks_and_Filters (1.T12)
HDMI_TX_CEC: HDMI_Source (D2.1 IC3.15), FPGA_Banks_and_Filters (1.T15)
HDMI_TX_CLK_N: HDMI_Source (IC3.13 R141.2), FPGA_Banks_and_Filters (1.P19)
HDMI_TX_CLK_P: HDMI_Source (IC3.12 R142.2), FPGA_Banks_and_Filters (1.N18)
HDMI_TX_HPD: HDMI_Source (R138.2 U17.4), FPGA_Banks_and_Filters (1.T14)
HDMI_TX_SCL: HDMI_Source (IC4.3 R151.2), FPGA_Banks_and_Filters (1.V20)
HDMI_TX_SDA: HDMI_Source (IC4.4 R152.2), FPGA_Banks_and_Filters (1.W20)
JA1_N: PMODs_MIO (P1.9 U2.1), FPGA_Banks_and_Filters (R259.1)
JA1_P: PMODs_MIO (P1.3 U2.2), FPGA_Banks_and_Filters (R261.1)
JA2_N: PMODs_MIO (P1.2 U2.3), FPGA_Banks_and_Filters (R260.1)
JA2_P: PMODs_MIO (P1.8 U2.4), FPGA_Banks_and_Filters (R262.1)
JA3_N: PMODs_MIO (P1.7 U1.1), FPGA_Banks_and_Filters (R263.1)
JA3_P: PMODs_MIO (P1.1 U1.2), FPGA_Banks_and_Filters (R265.1)
JA4_N: PMODs_MIO (P1.10 U1.3), FPGA_Banks_and_Filters (R264.1)
JA4_P: PMODs_MIO (P1.4 U1.4), FPGA_Banks_and_Filters (R266.1)
JB1_N: PMODs_MIO (R3.1), FPGA_Banks_and_Filters (1.V8)
JB1_P: PMODs_MIO (R4.2), FPGA_Banks_and_Filters (1.Y8)
JB2_N: PMODs_MIO (R5.1), FPGA_Banks_and_Filters (1.U7)
JB2_P: PMODs_MIO (R7.1), FPGA_Banks_and_Filters (1.V5)
JB3_N: PMODs_MIO (R6.2), FPGA_Banks_and_Filters (1.Y7)
JB3_P: PMODs_MIO (R1.1), FPGA_Banks_and_Filters (1.U10)
JB4_N: PMODs_MIO (R8.2), FPGA_Banks_and_Filters (1.V6)
JB4_P: PMODs_MIO (R2.2), FPGA_Banks_and_Filters (1.V10)
JC1_N: PMODs_MIO (R17.1), FPGA_Banks_and_Filters (1.J19)
JC1_P: PMODs_MIO (R18.2), FPGA_Banks_and_Filters (1.K19)
JC2_N: PMODs_MIO (R9.1), FPGA_Banks_and_Filters (1.B20)
JC2_P: PMODs_MIO (R10.2), FPGA_Banks_and_Filters (1.C20)
JC3_N: PMODs_MIO (R21.1), FPGA_Banks_and_Filters (1.M18)
JC3_P: PMODs_MIO (R22.2), FPGA_Banks_and_Filters (1.M17)
JC4_N: PMODs_MIO (R14.2), FPGA_Banks_and_Filters (1.A20)
JC4_P: PMODs_MIO (R13.1), FPGA_Banks_and_Filters (1.B19)
JD1_N: PMODs_MIO (R16.2), FPGA_Banks_and_Filters (1.E19)
JD1_P: PMODs_MIO (R15.1), FPGA_Banks_and_Filters (1.E18)
JD2_N: PMODs_MIO (R11.1), FPGA_Banks_and_Filters (1.F17)
JD2_P: PMODs_MIO (R12.2), FPGA_Banks_and_Filters (1.F16)
JD3_N: PMODs_MIO (R19.1), FPGA_Banks_and_Filters (1.L17)
JD3_P: PMODs_MIO (R20.2), FPGA_Banks_and_Filters (1.L16)
JD4_N: PMODs_MIO (R23.1), FPGA_Banks_and_Filters (1.N16)
JD4_P: PMODs_MIO (R24.2), FPGA_Banks_and_Filters (1.N15)
JE1: PMODs_MIO (R38.2), FPGA_Banks_and_Filters (1.D19)
JE2: PMODs_MIO (R26.2), FPGA_Banks_and_Filters (1.G20)
JE3: PMODs_MIO (R34.2), FPGA_Banks_and_Filters (1.T19)
JE4: PMODs_MIO (R29.1), FPGA_Banks_and_Filters (1.R16)
JE7: PMODs_MIO (R37.1), FPGA_Banks_and_Filters (1.D18)
JE8: PMODs_MIO (R25.1), FPGA_Banks_and_Filters (1.L20)
JE9: PMODs_MIO (R33.1), FPGA_Banks_and_Filters (1.K14)
JE10: PMODs_MIO (R30.2), FPGA_Banks_and_Filters (1.M20)
JF1: PMODs_MIO (R31.1), DDR_and_MIO_Banks (1.E8)
JF2: PMODs_MIO (R27.1), DDR_and_MIO_Banks (1.E9)
JF3: PMODs_MIO (R36.2), DDR_and_MIO_Banks (1.C6)
JF4: PMODs_MIO (R39.1), DDR_and_MIO_Banks (1.D9)
JF7: PMODs_MIO (R28.2), DDR_and_MIO_Banks (1.E6)
JF8: PMODs_MIO (R35.1), DDR_and_MIO_Banks (1.B5)
JF9: PMODs_MIO (R32.2), DDR_and_MIO_Banks (1.C5)
JF10: PMODs_MIO (R40.2), DDR_and_MIO_Banks (1.C8)
LD_MIO/VCFG0: PMODs_MIO (R43.2), DDR_and_MIO_Banks (1.D8 R245.2)
LED0: MIPI_General_IO (R65.2), FPGA_Banks_and_Filters (1.M19)
LED1: MIPI_General_IO (R62.2), FPGA_Banks_and_Filters (1.P18)
LED2: MIPI_General_IO (R61.2), FPGA_Banks_and_Filters (1.U19)
LED3: MIPI_General_IO (R58.2), FPGA_Banks_and_Filters (1.V13)
LED5_B: MIPI_General_IO (R74.2 R85.2), FPGA_Banks_and_Filters (1.U5)
LED5_G: MIPI_General_IO (R79.2 R84.2), FPGA_Banks_and_Filters (1.Y11)
LED5_R: MIPI_General_IO (R81.2 R83.2), FPGA_Banks_and_Filters (1.W11)
LED6_B: MIPI_General_IO (R76.2 R88.2), FPGA_Banks_and_Filters (1.W14)
LED6_G: MIPI_General_IO (R80.2 R87.2), FPGA_Banks_and_Filters (1.V15)
LED6_R: MIPI_General_IO (R82.2 R86.2), FPGA_Banks_and_Filters (1.R14)
LP_CLK_N: MIPI_General_IO (R54.1), FPGA_Banks_and_Filters (1.W15)
LP_CLK_P: MIPI_General_IO (R48.1), FPGA_Banks_and_Filters (1.Y19)
LP_LANE0_N: MIPI_General_IO (R52.1), FPGA_Banks_and_Filters (1.Y14)
LP_LANE0_P: MIPI_General_IO (R46.1), FPGA_Banks_and_Filters (1.T16)
LP_LANE1_N: MIPI_General_IO (R53.1), FPGA_Banks_and_Filters (1.U17)
LP_LANE1_P: MIPI_General_IO (R47.1), FPGA_Banks_and_Filters (1.Y18)
MIPI_CLK_N: MIPI_General_IO (J1.8 R51.2 R54.2), FPGA_Banks_and_Filters (1.P20)
MIPI_CLK_P: MIPI_General_IO (J1.9 R48.2 R51.1), FPGA_Banks_and_Filters (1.N20)
MIPI_LANE0_N: MIPI_General_IO (J1.2 R49.2 R52.2), FPGA_Banks_and_Filters (1.Y17)
MIPI_LANE0_P: MIPI_General_IO (J1.3 R46.2 R49.1), FPGA_Banks_and_Filters (1.Y16)
MIPI_LANE1_N: MIPI_General_IO (J1.5 R50.2 R53.2), FPGA_Banks_and_Filters (1.U15)
MIPI_LANE1_P: MIPI_General_IO (J1.6 R47.2 R50.1), FPGA_Banks_and_Filters (1.U14)
OTG_CLK: USB_OTG (R191.1 U20.1), DDR_and_MIO_Banks (1.A11)
OTG_DATA0: USB_OTG (U20.3), DDR_and_MIO_Banks (1.A14)
OTG_DATA1: USB_OTG (U20.4), DDR_and_MIO_Banks (1.D15)
OTG_DATA2: USB_OTG (U20.5), DDR_and_MIO_Banks (1.A12)
OTG_DATA3: USB_OTG (U20.6), DDR_and_MIO_Banks (1.F12)
OTG_DATA4: USB_OTG (U20.7), DDR_and_MIO_Banks (1.C16)
OTG_DATA5: USB_OTG (U20.9), DDR_and_MIO_Banks (1.A10)
OTG_DATA6: USB_OTG (U20.10), DDR_and_MIO_Banks (1.E13)
OTG_DATA7: USB_OTG (U20.13), DDR_and_MIO_Banks (1.C18)
OTG_DIR: USB_OTG (U20.31), DDR_and_MIO_Banks (1.C13)
OTG_NXT: USB_OTG (U20.2), DDR_and_MIO_Banks (1.E16)
OTG_OC: USB_OTG (R190.2 U21.3), FPGA_Banks_and_Filters (1.E17)
OTG_RESETN: USB_OTG (R194.1 U20.27), DDR_and_MIO_Banks (1.D16)
OTG_STP: USB_OTG (U20.29), DDR_and_MIO_Banks (1.C15)
PB0: PMODs_MIO (R41.2), DDR_and_MIO_Banks (1.B13)
PB1: PMODs_MIO (R42.2), DDR_and_MIO_Banks (1.B9)
PG_ALL_EDGE: Audio_Codec (U16.3), HDMI_Source (IC3.2), DDR_and_MIO_Banks (1.C7)
SD_CCLK: Ethernet_and_SD_Card (IC2.9), DDR_and_MIO_Banks (R234.1)
SD_CD: Ethernet_and_SD_Card (R116.2 R117.1), DDR_and_MIO_Banks (1.B14)
SD_CMD: Ethernet_and_SD_Card (IC2.4), DDR_and_MIO_Banks (1.C17)
SD_D0: Ethernet_and_SD_Card (IC2.6), DDR_and_MIO_Banks (1.E12)
SD_D1: Ethernet_and_SD_Card (IC2.7), DDR_and_MIO_Banks (1.A9)
SD_D2: Ethernet_and_SD_Card (IC2.1), DDR_and_MIO_Banks (1.F13)
SD_D3: Ethernet_and_SD_Card (IC2.3), DDR_and_MIO_Banks (1.B15)
SHIELD: Ethernet_and_SD_Card (J2.15 J2.16), USB_OTG (10 pins)
SPI_CS: FPGA_Config_Flash (R204.1 U24.1), DDR_and_MIO_Banks (1.A7)
SPI_DQ0/MODE0: FPGA_Config_Flash (U24.5), DDR_and_MIO_Banks (1.B8 R252.2)
SPI_DQ1/MODE1: FPGA_Config_Flash (U24.2), DDR_and_MIO_Banks (1.D6 R246.2)
SPI_DQ2/MODE2: FPGA_Config_Flash (U24.3), DDR_and_MIO_Banks (1.B7 R255.2)
SPI_DQ3/MODE3: FPGA_Config_Flash (U24.7), DDR_and_MIO_Banks (1.A6 R254.2)
SPI_SCK/MODE4: FPGA_Config_Flash (U24.6), DDR_and_MIO_Banks (R218.1 R258.2)
SW0: MIPI_General_IO (R56.1), FPGA_Banks_and_Filters (1.R17)
SW1: MIPI_General_IO (R70.1), FPGA_Banks_and_Filters (1.K16)
SW2: MIPI_General_IO (R64.1), FPGA_Banks_and_Filters (1.D20)
SW3: MIPI_General_IO (R60.1), FPGA_Banks_and_Filters (1.L19)
SYSCLK: Ethernet_and_SD_Card (C14.2 R114.2), FPGA_Banks_and_Filters (1.U18)
VIDEO_SHIELD: HDMI_Source (C54.2 J6.Shell R140.1), HDMI_Sink (J7.Shell)
VP: FPGA_Config_Flash (1.K9), Power_Regulation (R305.1 U28.19)